# Altium schematic sheet Other_Connectors.SchDoc
size A; SheetNumber: 6; SheetTotal: 7
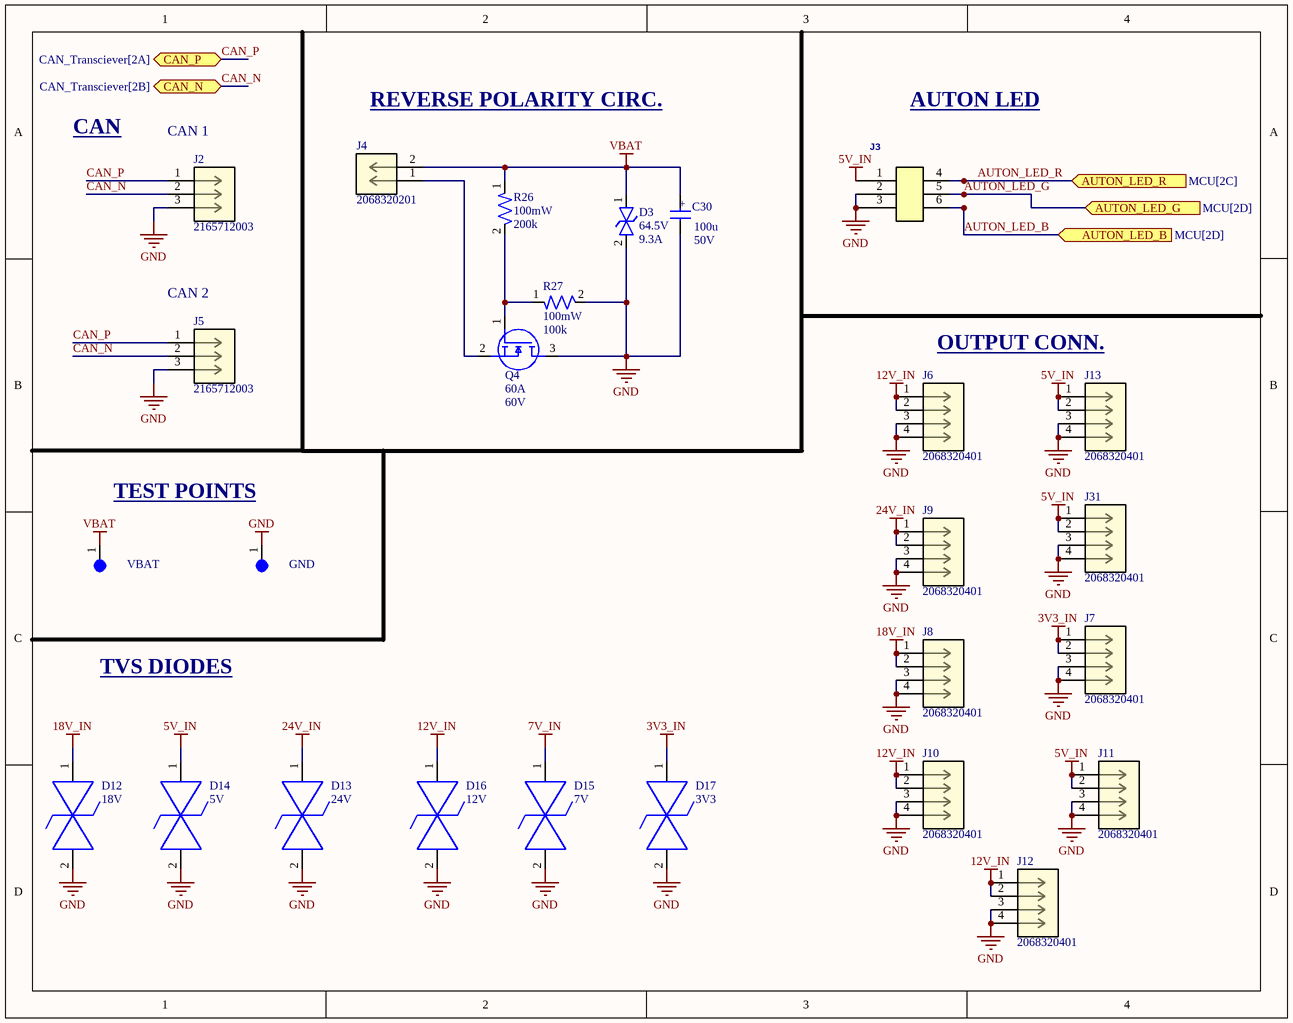
[diagram p0: Other_Connectors.SchDoc]

## Parts
C30  Capacitance: 100u  Voltage: 50V  [WCAP-ATUL_8X11.5(DXL)]  (hidden comment: 860040674004)
D3  Voltage Rating: 64.5V  Current Rating: 9.3A  [DO-214AA (SMBJ)]  (hidden comment: SMBJ40CA)
D12  Clamping Voltage: 18V  [DO-214AA (SMBJ)]  (hidden comment: SMBJ18)
D13  Voltage: 24V  [DO-214AA (SMBJ)]  (hidden comment: SMBJ5.0)
D14  Voltage: 5V  [DO-214AA (SMBJ)]  (hidden comment: SMBJ5.0)
D15  Voltage: 7V  [DO-214AA (SMBJ)]  (hidden comment: SMBJ12)
D16  Voltage: 12V  [DO-214AA (SMBJ)]  (hidden comment: SMBJ12)
D17  Voltage: 3V3  [DO-214AA (SMBJ)]  (hidden comment: SMBJ12)
GND  5003  [TEST-POINT-0001]  (value not drawn)
J2  2165712003  [CONN_2165710003-SD_03_MOL]
J3  Molex 43045-0612  [CONN_2068320000-SD_06_MOL]  (value not drawn)
J4  2068320201  [CONN_2068320000-SD_02_MOL]
J5  2165712003  [CONN_2165710003-SD_03_MOL]
J6  2068320401  [CONN_2068320000-SD_04_MOL]
J7  2068320401  [CONN_2068320000-SD_04_MOL]
J8  2068320401  [CONN_2068320000-SD_04_MOL]
J9  2068320401  [CONN_2068320000-SD_04_MOL]
J10  2068320401  [CONN_2068320000-SD_04_MOL]
J11  2068320401  [CONN_2068320000-SD_04_MOL]
J12  2068320401  [CONN_2068320000-SD_04_MOL]
J13  2068320401  [CONN_2068320000-SD_04_MOL]
J31  2068320401  [CONN_2068320000-SD_04_MOL]
Q4  Voltage: 60V  Continuous Current: 60A  [IC-8VSONCLIP]  (hidden comment: CSD18543Q3AT)
R26  Power: 100mW  Resistance: 200k  [RES-0603]  (hidden comment: RC0603FR-07200KL)
R27  Power: 100mW  Resistance: 100k  [RES-0603]  (hidden comment: RC0603FR-07100KL)
VBAT  5003  [TEST-POINT-0001]  (value not drawn)

## Ports
AUTON_LED_B (in, see MCU[2D]), AUTON_LED_G (in, see MCU[2D]), AUTON_LED_R (in, see MCU[2C]), CAN_N (bidir, see CAN_Transciever[2B]), CAN_P (bidir, see CAN_Transciever[2A])

## Nets
3V3_IN: D17.1 J7.1 J7.2
5V_IN: D14.1 J3.1 J11.1 J11.2 J13.1 J13.2 J31.1 J31.2
7V_IN: D15.1
12V_IN: D16.1 J6.1 J6.2 J10.1 J10.2 J12.1 J12.2
18V_IN: D12.1 J8.1 J8.2
24V_IN: D13.1 J9.1 J9.2
GND: C30.2(NEG) D3.2 D12.2 D13.2 D14.2 D15.2 D16.2 D17.2 GND.1 J2.3 J3.2 J3.3 J5.3 J6.3 J6.4 J7.3 J7.4 J8.3 J8.4 J9.3 J9.4 J10.3 J10.4 J11.3 J11.4 J12.3 J12.4 J13.3 J13.4 J31.3 J31.4 Q4.3(D) R27.2
VBAT: C30.1(POS) D3.1 J4.2 R26.1 VBAT.1
AUTON_LED_B: J3.6 ; port AUTON_LED_B
AUTON_LED_G: J3.5 ; port AUTON_LED_G
AUTON_LED_R: J3.4 ; port AUTON_LED_R
CAN_N: J2.2 J5.2 ; port CAN_N
CAN_P: J2.1 J5.1 ; port CAN_P
NetJ4_1: J4.1 Q4.2(S)
NetQ4_1: Q4.1(G) R26.2 R27.1

## Notes on the sheet
- CAN
- (near J2) CAN 1
- REVERSE POLARITY CIRC.
- AUTON LED
- (near J5) CAN 2
- OUTPUT CONN.
- TEST POINTS
- TVS DIODES
- (in symbol CAP-100U-0002) +

## Library data of the parts
C30 = CAP-100U-0002: 100 µF 50 V Aluminum Electrolytic Capacitors Radial, Can 7000 Hrs @ 105°C
D3 = DIO-TVS-0001: TVS DIODE 40VWM 64.5VC DO214AA; ComponentLink1Description: Datasheet; ComponentLink1URL: https://www.littelfuse.com/media?resourcetype=datasheets&itemid=09a6ae9a-73cb-4ac4-acac-e6dab92ab953&filename=littelfuse_tvs_diode_smbj_datasheet.pdf
D12 = DIODE-18V-0001: 30.66V Clamp 20.6A Ipp Tvs Diode Surface Mount DO-214AA (SMBJ); Manufacturer_Name: Littelfuse Inc; Copyright: Copyright (C) 2025 Ultra Librarian. All rights reserved.; Manufacturer_Part_Number: SMBJ18
D13 D14 = DIO-TVS-5V: 9.66V Clamp 65.3A Ipp Tvs Diode Surface Mount DO-214AA (SMBJ)
D15-D17 = DIO-TVS-12V: 20.9V Clamp 30.2A Ipp Tvs Diode Surface Mount DO-214AA (SMBJ)
GND VBAT = TEST-POINT-0001: Oranange PC Test Point, Miniature Phoisphor Bronze Silver Plating Through Hole Mounting Type
J2 J5 = CONN-3-POS-2: Micro-Fit+ Vertical Header, Through Hole, 3.00mm Pitch, Single Row, 3 Circuits, 0.38Âµm Gold (Au) Plating, Glow-Wire Capable, Black; Manufacturer_Name: Molex Connector Corporation; Copyright: Copyright (C) 2026 Ultra Librarian. All rights reserved.; Manufacturer_Part_Number: 2165712003; RefDes: RefDes; Type: Type
J3 = CONN-6POS-0001: CONN HEADER VERT 6POS 3MM; ComponentLink1Description: Datasheet; ComponentLink1URL: https://tools.molex.com/pdm_docs/ps/PS-43045.pdf
J4 = CONN-2-POS-2: Micro-Fit+ Vertical Header, Through Hole, 3.00mm Pitch, Dual Row, 2 Circuits, Tin (Sn) Plating, Glow-Wire Capable, Black, Tray; Manufacturer_Name: Molex Connector Corporation; Copyright: Copyright (C) 2025 Ultra Librarian. All rights reserved.; Manufacturer_Part_Number: 2068320201; RefDes: RefDes; Type: Type
J6-J13 J31 = CONN-4-POS-1: Micro-Fit+ Vertical Header, Through Hole, 3.00mm Pitch, Dual Row, 4 Circuits, Tin (Sn) Plating, Glow-Wire Capable, Black, Tray; Manufacturer_Name: Molex Connector Corporation; Copyright: Copyright (C) 2025 Ultra Librarian. All rights reserved.; Manufacturer_Part_Number: 2068320401; RefDes: RefDes; Type: Type
Q4 = NMOS-60A-0001: MOSFET N-CH 60V 12A/60A 8VSON; ComponentLink2Description: Datasheet; ComponentLink2URL: http://www.ti.com/lit/ds/symlink/csd18543q3a.pdf
R26 = RES-200k-0001: RES SMD 200K OHM 1% 1/10W 0603; Tolerance: 1%; Size: 0603; ComponentLink1Description: Datasheet; ComponentLink1URL: https://www.yageo.com/upload/media/product/products/datasheet/rchip/PYu-RC_Group_51_RoHS_L_12.pdf
R27 = RES-100k-0001: RES SMD 100K OHM 1% 1/10W 0603; Tolerance: 1%; Size: 0603; ComponentLink1Description: Datasheet; ComponentLink1URL: https://www.yageo.com/upload/media/product/products/datasheet/rchip/PYu-RC_Group_51_RoHS_L_12.pdf